# Altium schematic sheet 50_RADAR_IO_CAN.SchDoc
size 297 x 209 mm
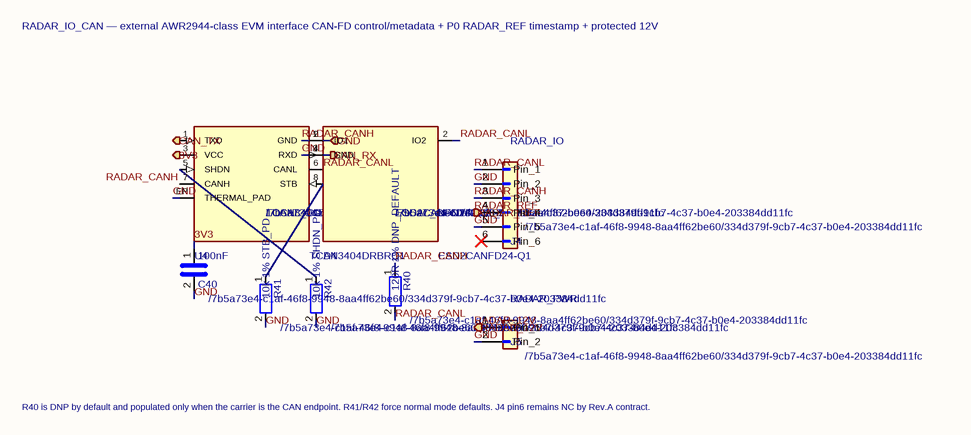
[diagram p0: 50_RADAR_IO_CAN.SchDoc]

## Parts
C40  hierarchy_path: /7b5a73e4-c1af-46f8-9948-8aa4ff62be60/334d379f-9cb7-4c37-b0e4-203384dd11fc  [C_0402_1005Metric]  (hidden comment: 100nF)
D4  Capture_Status: LOCAL_CONTRACT_SYMBOL  hierarchy_path: /7b5a73e4-c1af-46f8-9948-8aa4ff62be60/334d379f-9cb7-4c37-b0e4-203384dd11fc  [SOT-23]  (hidden comment: ESD2CANFD24-Q1)
J4  hierarchy_path: /7b5a73e4-c1af-46f8-9948-8aa4ff62be60/334d379f-9cb7-4c37-b0e4-203384dd11fc  [Molex_43045-0600_RA_THT_6P]  (hidden comment: RADAR_IO)
J5  hierarchy_path: /7b5a73e4-c1af-46f8-9948-8aa4ff62be60/334d379f-9cb7-4c37-b0e4-203384dd11fc  [Molex_43650-0200_RA_THT_2P]  (hidden comment: RADAR_PWR)
R40  hierarchy_path: /7b5a73e4-c1af-46f8-9948-8aa4ff62be60/334d379f-9cb7-4c37-b0e4-203384dd11fc  [R_0603_1608Metric]  (hidden comment: 120R 1% DNP_DEFAULT)
R41  hierarchy_path: /7b5a73e4-c1af-46f8-9948-8aa4ff62be60/334d379f-9cb7-4c37-b0e4-203384dd11fc  [R_0603_1608Metric]  (hidden comment: 10k 1% STB_PD)
R42  hierarchy_path: /7b5a73e4-c1af-46f8-9948-8aa4ff62be60/334d379f-9cb7-4c37-b0e4-203384dd11fc  [R_0603_1608Metric]  (hidden comment: 10k 1% SHDN_PD)
U4  Capture_Status: LOCAL_CONTRACT_SYMBOL  hierarchy_path: /7b5a73e4-c1af-46f8-9948-8aa4ff62be60/334d379f-9cb7-4c37-b0e4-203384dd11fc  [Texas_DRB0008A]  (hidden comment: TCAN3404DRBRQ1)

## Ports
3V3 (in), CAN_RX (out), CAN_TX (in), GND, RADAR_12V (in), RADAR_REF (out)

## Nets
3V3: U4.3(VCC) ; port 3V3
3V3: C40.1  [a separate net that carries the same name]
CAN_RX: U4.4(RXD) ; port CAN_RX
CAN_TX: U4.1(TXD) ; port CAN_TX
GND: C40.2 D4.3(GND) J4.2(Pin_2) J4.5(Pin_5) J5.2(Pin_2) R41.2 R42.2 U4.EP(THERMAL_PAD)
GND: U4.2(GND) ; port GND  [a separate net that carries the same name]
RADAR_12V: J5.1(Pin_1) ; port RADAR_12V
RADAR_CANH: D4.1(IO1) J4.3(Pin_3) R40.1 U4.7(CANH)
RADAR_CANL: D4.2(IO2) J4.1(Pin_1) R40.2 U4.6(CANL)
RADAR_REF: J4.4(Pin_4) ; port RADAR_REF
NetR41_1: R41.1 U4.8(STB)
NetR42_1: R42.1 U4.5(SHDN)

Not connected (* = marked no-connect by the designer): J4 6(Pin_6)*

## Notes on the sheet
- RADAR_IO_CAN — external AWR2944-class EVM interface
  CAN-FD control/metadata + P0 RADAR_REF timestamp + protected 12V
- R40 is DNP by default and populated only when the carrier is the CAN endpoint.
  R41/R42 force normal mode defaults. J4 pin6 remains NC by Rev.A contract.
- 1
- 2
- 3
- 4
- 5
- 6
- A
- B
- C
- D
- Title: EVT_SYS_CARRIER
- File: 50_RADAR_IO_CAN.kicad_sch
- Sheet: /
- KiCad E.D.A.  kicad (5.1.4)-1
- Size: A4
- Date:
- Rev:
- Id: 1/1

## Library data of the parts
C40 = C: Value: 100nF; Footprint: Capacitor_SMD:C_0402_1005Metric
D4 = ESD2CANFD24DBZRQ1: MPN: ESD2CANFD24DBZRQ1; Value: ESD2CANFD24-Q1; Footprint: Package_TO_SOT_SMD:SOT-23
J4 = Conn_01x06: Value: RADAR_IO; Footprint: SystemCarrier_Altium:Molex_43045-0600_RA_THT_6P
J5 = Conn_01x02: Value: RADAR_PWR; Footprint: SystemCarrier_Altium:Molex_43650-0200_RA_THT_2P
R40-R42 = R: Footprint: Resistor_SMD:R_0603_1608Metric
  R40: Value: 120R 1% DNP_DEFAULT
  R41: Value: 10k 1% STB_PD
  R42: Value: 10k 1% SHDN_PD
U4 = TCAN3404DRBRQ1: MPN: TCAN3404DRBRQ1; Value: TCAN3404DRBRQ1; Footprint: Package_DFN_QFN:Texas_DRB0008A